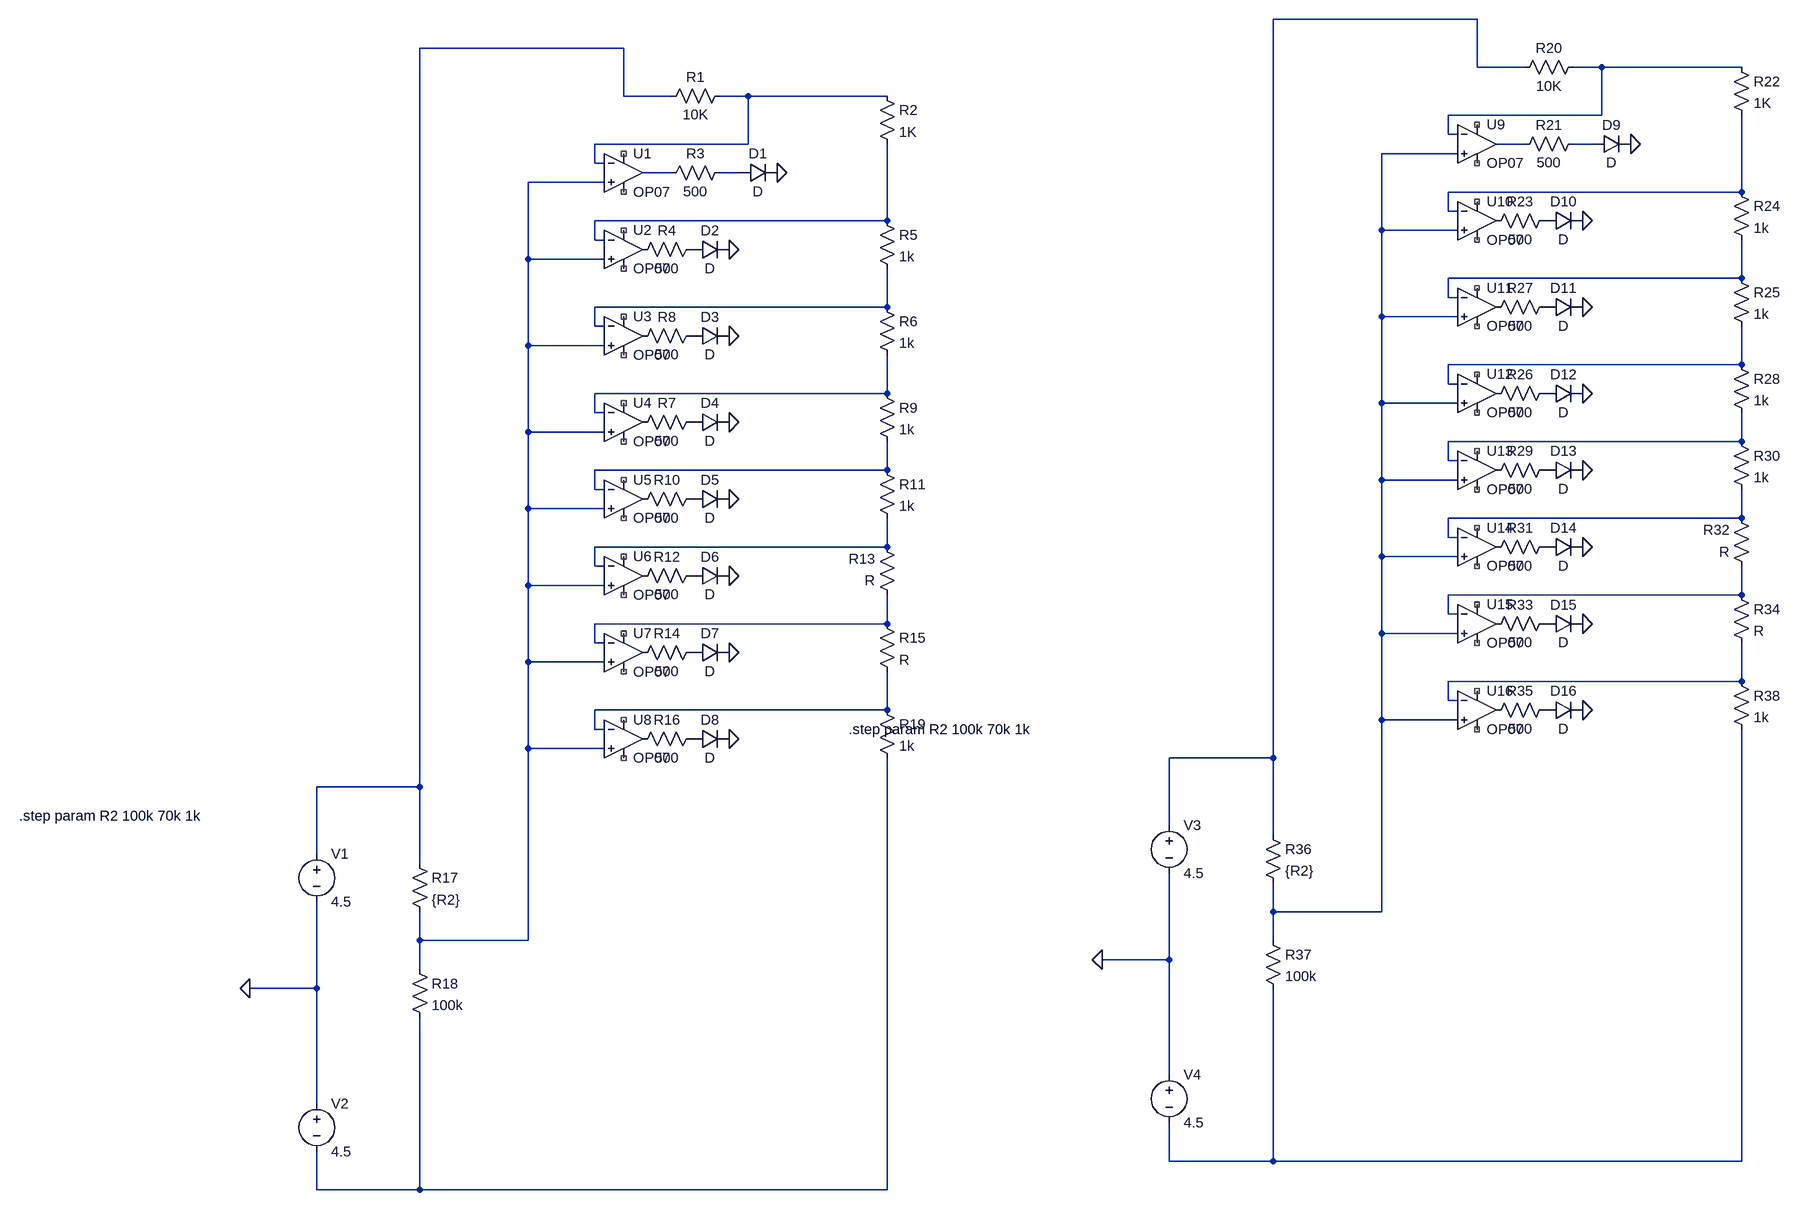
[diagram p0: schematic Draft1.asc]
Draft1.asc, the LTspice schematic file:
Version 4.1
SHEET 1 4932 680
WIRE 4368 -1776 3840 -1776
WIRE 784 -1728 256 -1728
WIRE 4368 -1696 4368 -1776
WIRE 4448 -1696 4368 -1696
WIRE 4576 -1696 4528 -1696
WIRE 4864 -1696 4576 -1696
WIRE 784 -1648 784 -1728
WIRE 864 -1648 784 -1648
WIRE 992 -1648 944 -1648
WIRE 1280 -1648 992 -1648
WIRE 4576 -1616 4576 -1696
WIRE 4576 -1616 4320 -1616
WIRE 4320 -1584 4320 -1616
WIRE 4336 -1584 4320 -1584
WIRE 992 -1568 992 -1648
WIRE 992 -1568 736 -1568
WIRE 4448 -1568 4400 -1568
WIRE 4560 -1568 4528 -1568
WIRE 4336 -1552 4144 -1552
WIRE 736 -1536 736 -1568
WIRE 752 -1536 736 -1536
WIRE 864 -1520 816 -1520
WIRE 976 -1520 944 -1520
WIRE 752 -1504 560 -1504
WIRE 4864 -1488 4864 -1616
WIRE 4864 -1488 4320 -1488
WIRE 4320 -1456 4320 -1488
WIRE 4336 -1456 4320 -1456
WIRE 1280 -1440 1280 -1568
WIRE 1280 -1440 736 -1440
WIRE 4144 -1424 4144 -1552
WIRE 4336 -1424 4144 -1424
WIRE 736 -1408 736 -1440
WIRE 752 -1408 736 -1408
WIRE 560 -1376 560 -1504
WIRE 752 -1376 560 -1376
WIRE 4864 -1344 4864 -1408
WIRE 4864 -1344 4320 -1344
WIRE 4320 -1312 4320 -1344
WIRE 4336 -1312 4320 -1312
WIRE 1280 -1296 1280 -1360
WIRE 1280 -1296 736 -1296
WIRE 4144 -1280 4144 -1424
WIRE 4336 -1280 4144 -1280
WIRE 736 -1264 736 -1296
WIRE 752 -1264 736 -1264
WIRE 560 -1232 560 -1376
WIRE 752 -1232 560 -1232
WIRE 4864 -1200 4864 -1264
WIRE 4864 -1200 4320 -1200
WIRE 4320 -1168 4320 -1200
WIRE 4336 -1168 4320 -1168
WIRE 1280 -1152 1280 -1216
WIRE 1280 -1152 736 -1152
WIRE 4144 -1136 4144 -1280
WIRE 4336 -1136 4144 -1136
WIRE 736 -1120 736 -1152
WIRE 752 -1120 736 -1120
WIRE 560 -1088 560 -1232
WIRE 752 -1088 560 -1088
WIRE 4864 -1072 4864 -1120
WIRE 4864 -1072 4320 -1072
WIRE 4320 -1040 4320 -1072
WIRE 4336 -1040 4320 -1040
WIRE 1280 -1024 1280 -1072
WIRE 1280 -1024 736 -1024
WIRE 4144 -1008 4144 -1136
WIRE 4336 -1008 4144 -1008
WIRE 736 -992 736 -1024
WIRE 752 -992 736 -992
WIRE 560 -960 560 -1088
WIRE 752 -960 560 -960
WIRE 4864 -944 4864 -992
WIRE 4864 -944 4320 -944
WIRE 4320 -912 4320 -944
WIRE 4336 -912 4320 -912
WIRE 1280 -896 1280 -944
WIRE 1280 -896 736 -896
WIRE 4144 -880 4144 -1008
WIRE 4336 -880 4144 -880
WIRE 736 -864 736 -896
WIRE 752 -864 736 -864
WIRE 560 -832 560 -960
WIRE 752 -832 560 -832
WIRE 4864 -816 4864 -864
WIRE 4864 -816 4320 -816
WIRE 4320 -784 4320 -816
WIRE 4336 -784 4320 -784
WIRE 1280 -768 1280 -816
WIRE 1280 -768 736 -768
WIRE 4144 -752 4144 -880
WIRE 4336 -752 4144 -752
WIRE 736 -736 736 -768
WIRE 752 -736 736 -736
WIRE 560 -704 560 -832
WIRE 752 -704 560 -704
WIRE 4864 -672 4864 -736
WIRE 4864 -672 4320 -672
WIRE 4320 -640 4320 -672
WIRE 4336 -640 4320 -640
WIRE 1280 -624 1280 -688
WIRE 1280 -624 736 -624
WIRE 4144 -608 4144 -752
WIRE 4336 -608 4144 -608
WIRE 736 -592 736 -624
WIRE 752 -592 736 -592
WIRE 560 -560 560 -704
WIRE 752 -560 560 -560
WIRE 3840 -544 3840 -1776
WIRE 3840 -544 3600 -544
WIRE 256 -496 256 -1728
WIRE 256 -496 16 -496
WIRE 3600 -432 3600 -544
WIRE 3840 -416 3840 -544
WIRE 16 -384 16 -496
WIRE 256 -368 256 -496
WIRE 3840 -288 3840 -336
WIRE 4144 -288 4144 -608
WIRE 4144 -288 3840 -288
WIRE 256 -240 256 -288
WIRE 560 -240 560 -560
WIRE 560 -240 256 -240
WIRE 3840 -240 3840 -288
WIRE 3600 -208 3600 -352
WIRE 3600 -208 3488 -208
WIRE 256 -192 256 -240
WIRE 16 -160 16 -304
WIRE 16 -160 -96 -160
WIRE 3600 -16 3600 -208
WIRE 16 32 16 -160
WIRE 3600 128 3600 64
WIRE 3840 128 3840 -160
WIRE 3840 128 3600 128
WIRE 4864 128 4864 -592
WIRE 4864 128 3840 128
WIRE 16 176 16 112
WIRE 256 176 256 -112
WIRE 256 176 16 176
WIRE 1280 176 1280 -544
WIRE 1280 176 256 176
FLAG -96 -160 0
FLAG 1040 -1520 0
FLAG 960 -1392 0
FLAG 960 -1248 0
FLAG 960 -1104 0
FLAG 960 -976 0
FLAG 960 -848 0
FLAG 960 -720 0
FLAG 960 -576 0
FLAG 3488 -208 0
FLAG 4624 -1568 0
FLAG 4544 -1440 0
FLAG 4544 -1296 0
FLAG 4544 -1152 0
FLAG 4544 -1024 0
FLAG 4544 -896 0
FLAG 4544 -768 0
FLAG 4544 -624 0
SYMBOL voltage 16 -400 R0
WINDOW 123 0 0 Left 0
WINDOW 39 0 0 Left 0
SYMATTR InstName V1
SYMATTR Value 4.5
SYMBOL voltage 16 16 R0
WINDOW 123 0 0 Left 0
WINDOW 39 0 0 Left 0
SYMATTR InstName V2
SYMATTR Value 4.5
SYMBOL res 960 -1664 R90
WINDOW 0 0 56 VBottom 2
WINDOW 3 32 56 VTop 2
SYMATTR InstName R1
SYMATTR Value 10K
SYMBOL OpAmps\\OP07 784 -1584 R0
SYMATTR InstName U1
SYMBOL res 960 -1536 R90
WINDOW 0 0 56 VBottom 2
WINDOW 3 32 56 VTop 2
SYMATTR InstName R3
SYMATTR Value 500
SYMBOL diode 976 -1504 R270
WINDOW 0 32 32 VTop 2
WINDOW 3 0 32 VBottom 2
SYMATTR InstName D1
SYMBOL res 1264 -1664 R0
SYMATTR InstName R2
SYMATTR Value 1K
SYMBOL OpAmps\\OP07 784 -1456 R0
SYMATTR InstName U2
SYMBOL res 912 -1408 R90
WINDOW 0 0 56 VBottom 2
WINDOW 3 32 56 VTop 2
SYMATTR InstName R4
SYMATTR Value 500
SYMBOL res 1264 -1456 R0
SYMATTR InstName R5
SYMATTR Value 1k
SYMBOL OpAmps\\OP07 784 -1312 R0
SYMATTR InstName U3
SYMBOL res 1264 -1312 R0
SYMATTR InstName R6
SYMATTR Value 1k
SYMBOL OpAmps\\OP07 784 -1168 R0
SYMATTR InstName U4
SYMBOL res 912 -1120 R90
WINDOW 0 0 56 VBottom 2
WINDOW 3 32 56 VTop 2
SYMATTR InstName R7
SYMATTR Value 500
SYMBOL res 912 -1264 R90
WINDOW 0 0 56 VBottom 2
WINDOW 3 32 56 VTop 2
SYMATTR InstName R8
SYMATTR Value 500
SYMBOL res 1264 -1168 R0
SYMATTR InstName R9
SYMATTR Value 1k
SYMBOL OpAmps\\OP07 784 -1040 R0
SYMATTR InstName U5
SYMBOL res 912 -992 R90
WINDOW 0 0 56 VBottom 2
WINDOW 3 32 56 VTop 2
SYMATTR InstName R10
SYMATTR Value 500
SYMBOL res 1264 -1040 R0
SYMATTR InstName R11
SYMATTR Value 1k
SYMBOL OpAmps\\OP07 784 -912 R0
SYMATTR InstName U6
SYMBOL res 912 -864 R90
WINDOW 0 0 56 VBottom 2
WINDOW 3 32 56 VTop 2
SYMATTR InstName R12
SYMATTR Value 500
SYMBOL res 1296 -800 R180
WINDOW 0 36 76 Left 2
WINDOW 3 36 40 Left 2
SYMATTR InstName R13
SYMBOL OpAmps\\OP07 784 -784 R0
SYMATTR InstName U7
SYMBOL res 912 -736 R90
WINDOW 0 0 56 VBottom 2
WINDOW 3 32 56 VTop 2
SYMATTR InstName R14
SYMATTR Value 500
SYMBOL res 1264 -784 R0
SYMATTR InstName R15
SYMBOL OpAmps\\OP07 784 -640 R0
SYMATTR InstName U8
SYMBOL res 912 -592 R90
WINDOW 0 0 56 VBottom 2
WINDOW 3 32 56 VTop 2
SYMATTR InstName R16
SYMATTR Value 500
SYMBOL res 240 -384 R0
SYMATTR InstName R17
SYMATTR Value {R2}
SYMBOL res 240 -208 R0
SYMATTR InstName R18
SYMATTR Value 100k
SYMBOL diode 896 -1376 R270
WINDOW 0 32 32 VTop 2
WINDOW 3 0 32 VBottom 2
SYMATTR InstName D2
SYMBOL diode 896 -1232 R270
WINDOW 0 32 32 VTop 2
WINDOW 3 0 32 VBottom 2
SYMATTR InstName D3
SYMBOL diode 896 -1088 R270
WINDOW 0 32 32 VTop 2
WINDOW 3 0 32 VBottom 2
SYMATTR InstName D4
SYMBOL diode 896 -960 R270
WINDOW 0 32 32 VTop 2
WINDOW 3 0 32 VBottom 2
SYMATTR InstName D5
SYMBOL diode 896 -832 R270
WINDOW 0 32 32 VTop 2
WINDOW 3 0 32 VBottom 2
SYMATTR InstName D6
SYMBOL diode 896 -704 R270
WINDOW 0 32 32 VTop 2
WINDOW 3 0 32 VBottom 2
SYMATTR InstName D7
SYMBOL diode 896 -560 R270
WINDOW 0 32 32 VTop 2
WINDOW 3 0 32 VBottom 2
SYMATTR InstName D8
SYMBOL res 1264 -640 R0
SYMATTR InstName R19
SYMATTR Value 1k
SYMBOL voltage 3600 -448 R0
WINDOW 123 0 0 Left 0
WINDOW 39 0 0 Left 0
SYMATTR InstName V3
SYMATTR Value 4.5
SYMBOL voltage 3600 -32 R0
WINDOW 123 0 0 Left 0
WINDOW 39 0 0 Left 0
SYMATTR InstName V4
SYMATTR Value 4.5
SYMBOL res 4544 -1712 R90
WINDOW 0 0 56 VBottom 2
WINDOW 3 32 56 VTop 2
SYMATTR InstName R20
SYMATTR Value 10K
SYMBOL OpAmps\\OP07 4368 -1632 R0
SYMATTR InstName U9
SYMBOL res 4544 -1584 R90
WINDOW 0 0 56 VBottom 2
WINDOW 3 32 56 VTop 2
SYMATTR InstName R21
SYMATTR Value 500
SYMBOL diode 4560 -1552 R270
WINDOW 0 32 32 VTop 2
WINDOW 3 0 32 VBottom 2
SYMATTR InstName D9
SYMBOL res 4848 -1712 R0
SYMATTR InstName R22
SYMATTR Value 1K
SYMBOL OpAmps\\OP07 4368 -1504 R0
SYMATTR InstName U10
SYMBOL res 4496 -1456 R90
WINDOW 0 0 56 VBottom 2
WINDOW 3 32 56 VTop 2
SYMATTR InstName R23
SYMATTR Value 500
SYMBOL res 4848 -1504 R0
SYMATTR InstName R24
SYMATTR Value 1k
SYMBOL OpAmps\\OP07 4368 -1360 R0
SYMATTR InstName U11
SYMBOL res 4848 -1360 R0
SYMATTR InstName R25
SYMATTR Value 1k
SYMBOL OpAmps\\OP07 4368 -1216 R0
SYMATTR InstName U12
SYMBOL res 4496 -1168 R90
WINDOW 0 0 56 VBottom 2
WINDOW 3 32 56 VTop 2
SYMATTR InstName R26
SYMATTR Value 500
SYMBOL res 4496 -1312 R90
WINDOW 0 0 56 VBottom 2
WINDOW 3 32 56 VTop 2
SYMATTR InstName R27
SYMATTR Value 500
SYMBOL res 4848 -1216 R0
SYMATTR InstName R28
SYMATTR Value 1k
SYMBOL OpAmps\\OP07 4368 -1088 R0
SYMATTR InstName U13
SYMBOL res 4496 -1040 R90
WINDOW 0 0 56 VBottom 2
WINDOW 3 32 56 VTop 2
SYMATTR InstName R29
SYMATTR Value 500
SYMBOL res 4848 -1088 R0
SYMATTR InstName R30
SYMATTR Value 1k
SYMBOL OpAmps\\OP07 4368 -960 R0
SYMATTR InstName U14
SYMBOL res 4496 -912 R90
WINDOW 0 0 56 VBottom 2
WINDOW 3 32 56 VTop 2
SYMATTR InstName R31
SYMATTR Value 500
SYMBOL res 4880 -848 R180
WINDOW 0 36 76 Left 2
WINDOW 3 36 40 Left 2
SYMATTR InstName R32
SYMBOL OpAmps\\OP07 4368 -832 R0
SYMATTR InstName U15
SYMBOL res 4496 -784 R90
WINDOW 0 0 56 VBottom 2
WINDOW 3 32 56 VTop 2
SYMATTR InstName R33
SYMATTR Value 500
SYMBOL res 4848 -832 R0
SYMATTR InstName R34
SYMBOL OpAmps\\OP07 4368 -688 R0
SYMATTR InstName U16
SYMBOL res 4496 -640 R90
WINDOW 0 0 56 VBottom 2
WINDOW 3 32 56 VTop 2
SYMATTR InstName R35
SYMATTR Value 500
SYMBOL res 3824 -432 R0
SYMATTR InstName R36
SYMATTR Value {R2}
SYMBOL res 3824 -256 R0
SYMATTR InstName R37
SYMATTR Value 100k
SYMBOL diode 4480 -1424 R270
WINDOW 0 32 32 VTop 2
WINDOW 3 0 32 VBottom 2
SYMATTR InstName D10
SYMBOL diode 4480 -1280 R270
WINDOW 0 32 32 VTop 2
WINDOW 3 0 32 VBottom 2
SYMATTR InstName D11
SYMBOL diode 4480 -1136 R270
WINDOW 0 32 32 VTop 2
WINDOW 3 0 32 VBottom 2
SYMATTR InstName D12
SYMBOL diode 4480 -1008 R270
WINDOW 0 32 32 VTop 2
WINDOW 3 0 32 VBottom 2
SYMATTR InstName D13
SYMBOL diode 4480 -880 R270
WINDOW 0 32 32 VTop 2
WINDOW 3 0 32 VBottom 2
SYMATTR InstName D14
SYMBOL diode 4480 -752 R270
WINDOW 0 32 32 VTop 2
WINDOW 3 0 32 VBottom 2
SYMATTR InstName D15
SYMBOL diode 4480 -608 R270
WINDOW 0 32 32 VTop 2
WINDOW 3 0 32 VBottom 2
SYMATTR InstName D16
SYMBOL res 4848 -688 R0
SYMATTR InstName R38
SYMATTR Value 1k
TEXT -480 -448 Left 2 !.step param R2 100k 70k 1k
TEXT 1216 -592 Left 2 !.step param R2 100k 70k 1k

The netlist it stands for:
* Draft1.asc
V1 N002 0 4.5
V2 0 N026 4.5
R1 N004 N002 10K
X§U1 N010 N004 NC_01 NC_02 N008 LT1001  ; OP07, pins In+ In- V+ V- OUT
R3 N009 N008 500
D1 N009 0 D
R2 N004 N012 1K
X§U2 N010 N012 NC_03 NC_04 P001 LT1001  ; OP07, pins In+ In- V+ V- OUT
R4 P002 P001 500
R5 N012 N014 1k
X§U3 N010 N014 NC_05 NC_06 P003 LT1001  ; OP07, pins In+ In- V+ V- OUT
R6 N014 N016 1k
X§U4 N010 N016 NC_07 NC_08 P004 LT1001  ; OP07, pins In+ In- V+ V- OUT
R7 P005 P004 500
R8 P006 P003 500
R9 N016 N018 1k
X§U5 N010 N018 NC_09 NC_10 P007 LT1001  ; OP07, pins In+ In- V+ V- OUT
R10 P008 P007 500
R11 N018 N020 1k
X§U6 N010 N020 NC_11 NC_12 P009 LT1001  ; OP07, pins In+ In- V+ V- OUT
R12 P010 P009 500
R13 N022 N020 R
X§U7 N010 N022 NC_13 NC_14 P011 LT1001  ; OP07, pins In+ In- V+ V- OUT
R14 P012 P011 500
R15 N022 N024 R
X§U8 N010 N024 NC_15 NC_16 P013 LT1001  ; OP07, pins In+ In- V+ V- OUT
R16 P014 P013 500
R17 N002 N010 {R2}
R18 N010 N026 100k
D2 P002 0 D
D3 P006 0 D
D4 P005 0 D
D5 P008 0 D
D6 P010 0 D
D7 P012 0 D
D8 P014 0 D
R19 N024 N026 1k
V3 N001 0 4.5
V4 0 N025 4.5
R20 N003 N001 10K
X§U9 N007 N003 NC_17 NC_18 N005 LT1001  ; OP07, pins In+ In- V+ V- OUT
R21 N006 N005 500
D9 N006 0 D
R22 N003 N011 1K
X§U10 N007 N011 NC_19 NC_20 P015 LT1001  ; OP07, pins In+ In- V+ V- OUT
R23 P016 P015 500
R24 N011 N013 1k
X§U11 N007 N013 NC_21 NC_22 P017 LT1001  ; OP07, pins In+ In- V+ V- OUT
R25 N013 N015 1k
X§U12 N007 N015 NC_23 NC_24 P018 LT1001  ; OP07, pins In+ In- V+ V- OUT
R26 P019 P018 500
R27 P020 P017 500
R28 N015 N017 1k
X§U13 N007 N017 NC_25 NC_26 P021 LT1001  ; OP07, pins In+ In- V+ V- OUT
R29 P022 P021 500
R30 N017 N019 1k
X§U14 N007 N019 NC_27 NC_28 P023 LT1001  ; OP07, pins In+ In- V+ V- OUT
R31 P024 P023 500
R32 N021 N019 R
X§U15 N007 N021 NC_29 NC_30 P025 LT1001  ; OP07, pins In+ In- V+ V- OUT
R33 P026 P025 500
R34 N021 N023 R
X§U16 N007 N023 NC_31 NC_32 P027 LT1001  ; OP07, pins In+ In- V+ V- OUT
R35 P028 P027 500
R36 N001 N007 {R2}
R37 N007 N025 100k
D10 P016 0 D
D11 P020 0 D
D12 P019 0 D
D13 P022 0 D
D14 P024 0 D
D15 P026 0 D
D16 P028 0 D
R38 N023 N025 1k
.model D D
.lib standard.dio
.step param R2 100k 70k 1k
.step param R2 100k 70k 1k
.lib LTC.lib
.backanno
.end